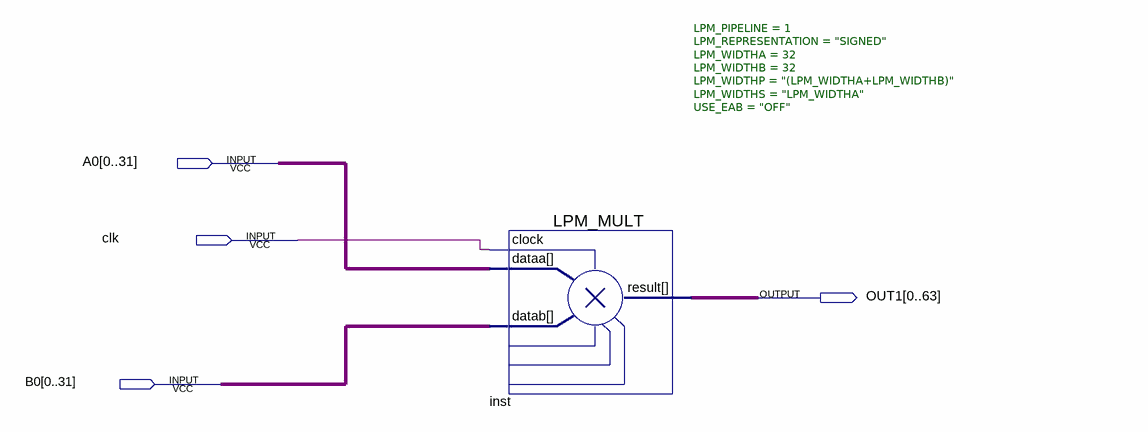
[diagram p0: schematic sheet]
// Quartus schematic TP1.bdf as structural Verilog: 1 symbols, 4 pins
module TP1 (
  input  [0:31] A0,
  input  clk,
  input  [0:31] B0,
  output [0:63] OUT1
);

  LPM_MULT #(.LPM_PIPELINE(1), .LPM_REPRESENTATION("SIGNED"), .LPM_WIDTHA(32), .LPM_WIDTHB(32), .LPM_WIDTHP("(LPM_WIDTHA+LPM_WIDTHB)"), .LPM_WIDTHS("LPM_WIDTHA"), .USE_EAB("OFF")) inst (
    .clock(clk), .dataa(A0), .datab(B0), .result(OUT1));
endmodule
